# Altium schematic sheet Load8.SchDoc
size A4; SheetNumber: 11; SheetTotal: 15
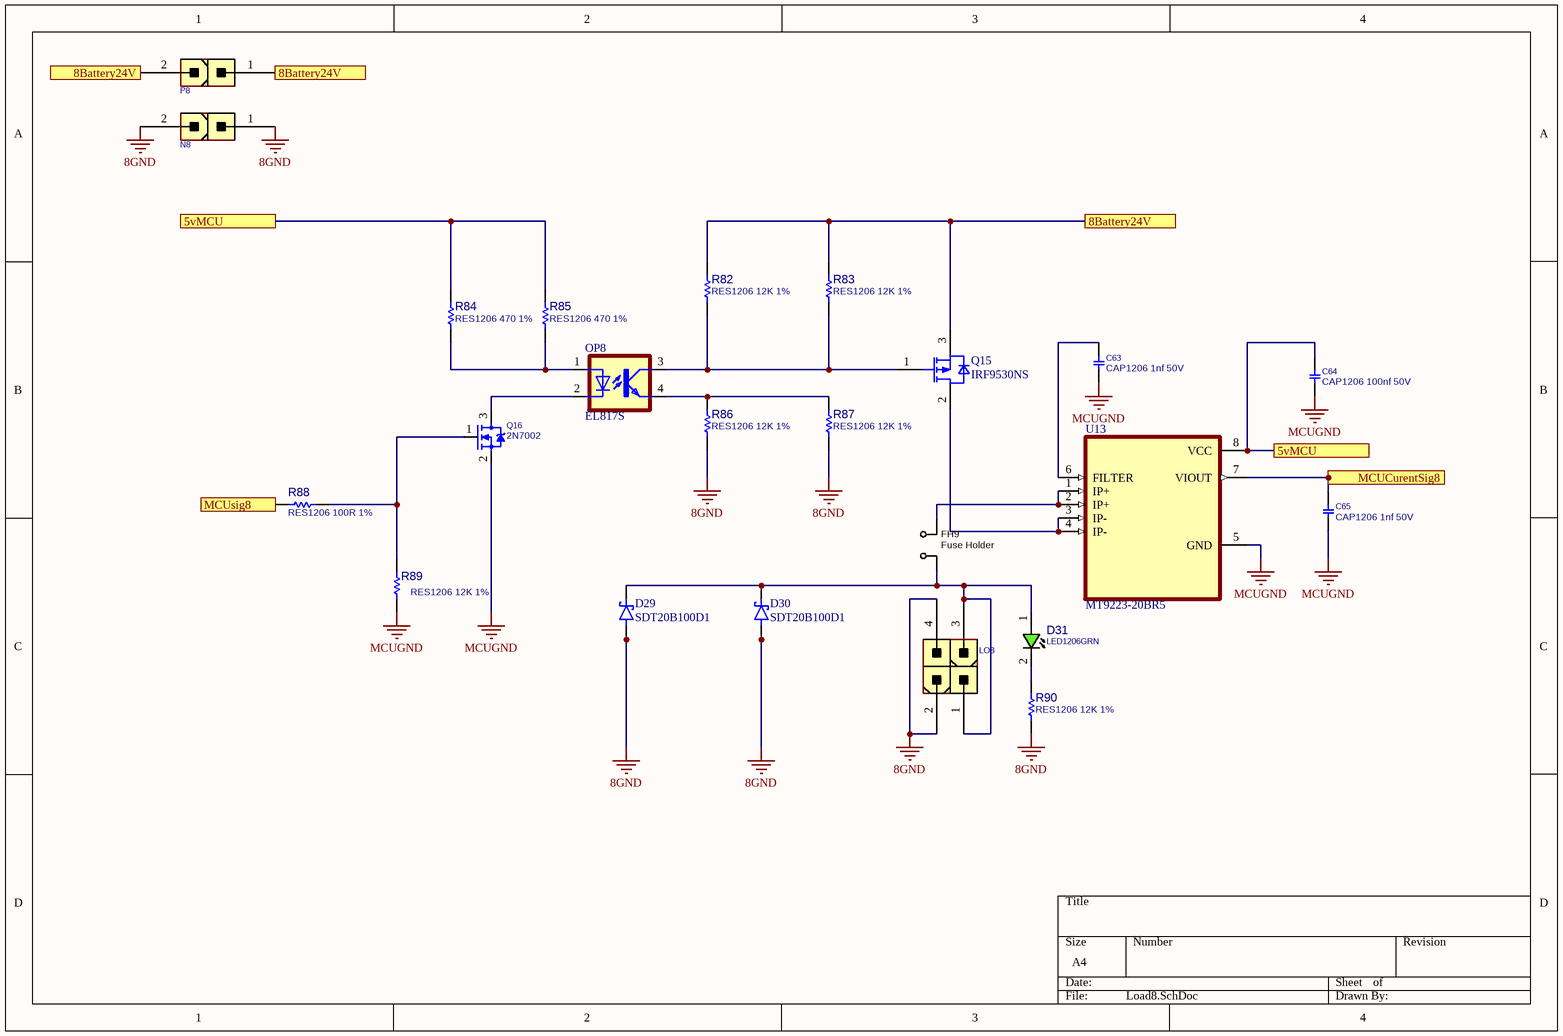
[diagram p0: Load8.SchDoc]

## Parts
C63  CAP1206 1nf 50V  [C1206]
C64  CAP1206 100nf 50V  [C1206]
C65  CAP1206 1nf 50V  [C1206]
D29  SDT20B100D1  [DPAK229P990X238-3N]
D30  SDT20B100D1  [DPAK229P990X238-3N]
D31  LED1206GRN  [LED1206GRN]
FH9  Fuse Holder  [FH_24101812]
LO8  CONN_ATXPWR_4  [ATXPWR_4]  (value not drawn)
N8  CONN_ATXPWR_2  [ATXPWR_2]  (value not drawn)
OP8  EL817S  [SOIC254P1030X460-4N]
P8  CONN_ATXPWR_2  [ATXPWR_2]  (value not drawn)
Q15  IRF9530NS  [TO254P1528X508-4_3N-V1]
Q16  2N7002  [SOT23_3]
R82  RES1206 12K 1%  [R1206]
R83  RES1206 12K 1%  [R1206]
R84  RES1206 470 1%  [R1206]
R85  RES1206 470 1%  [R1206]
R86  RES1206 12K 1%  [R1206]
R87  RES1206 12K 1%  [R1206]
R88  RES1206 100R 1%  [R1206]
R89  RES1206 12K 1%  [R1206]
R90  RES1206 12K 1%  [R1206]
U13  MT9223-20BR5  [SOIC127P600X175-8N]

## Ports
5vMCU, 8Battery24V, MCUCurentSig8, MCUsig8

## Nets
8GND: D29.1(A) D29.3(A__1) D30.1(A) D30.3(A__1) LO8.2 LO8.4 N8.1 N8.2 R86.2 R87.2 R90.2
MCUGND: C63.2 C64.2 C65.2 Q16.2(SOURCE) R89.2 U13.5(GND)
5vMCU: C64.1 R84.2 R85.2 U13.8(VCC) ; port 5vMCU
8Battery24V: P8.1 P8.2 Q15.3(SOURCE) R82.1 R83.1 ; port 8Battery24V
MCUCurentSig8: C65.1 U13.7(VIOUT) ; port MCUCurentSig8
MCUsig8: R88.1 ; port MCUsig8
NetC63_1: C63.1 U13.6(FILTER)
NetD29_4: D29.4(K) D30.4(K) D31.1(ANODE) FH9.1 LO8.1 LO8.3
NetD31_2: D31.2(CATHODE) R90.1
NetFH9_2: FH9.2 U13.1(IP+) U13.2(IP+)
NetOP8_1: OP8.1(A) R84.1 R85.1
NetOP8_2: OP8.2(C) Q16.3(DRAIN)
NetOP8_3: OP8.3(COL) Q15.1(GATE) R82.2 R83.2
NetOP8_4: OP8.4(EMIT) R86.1 R87.1
NetQ15_2: Q15.2(DRAIN) U13.3(IP-) U13.4(IP-)
NetQ16_1: Q16.1(GATE) R88.2 R89.1

## Library data of the parts
C63-C65 = CAP_SMD_MLCC_1206: CAP, MLCC; PARAM: -, -%; MANF_P#: MANF_PART#; PARAM2: -V; PRICE: 100= 1$; MANF: -; ASSEMBLY: ASSEMBLY
D29 D30 = MBRD835L: Diode Schottky 35 V 8A Surface Mount DPAK; MF: ON Semiconductor; SnapEDA_Link: https://www.snapeda.com/parts/MBRD835L/Onsemi/view-part/?ref=snap; Package: TO-252-3 MICROSS/On Semiconductor; Value: *; MP: MBRD835L; Check_prices: https://www.snapeda.com/parts/MBRD835L/Onsemi/view-part/?ref=eda
D31 = LED_SMD_1206_GRN: LED, SMD, 1206, GREEN; PARAM: 20mA; DESC: DESCRIPTION; PARAM2: 2.2V; MANF: -; ASSEMBLY: ASSEMBLY; PRICE: 36t@Javan; MANF_P#: -; VALUE: LED1206GRN; MountType: SMT; PartType: LED
FH9 = FUSE_SMD_HOLDER_24101812: Fuse SMD2410 Holder; PARAM: max. 10A; MANF: Littelfuse; MANF_P#: 01550900M; PARAM2: 125v; PRICE: 0.2$; PACKAGE: SMD,5.0x9.7mm; VALUE: Fuse Holder
LO8 = CONN_ATXPWR_4: CONN, ATX POWER, 4 P; MANF: TE, Molex; MANF_P#: 4-1775099-0, 39281043; VALUE: CONN_ATXPWR_4; MountType: THD; PACKAGE: ATXPWR-4pin; Part Type: Conn.
N8 P8 = CONN_ATXPWR_2: CONN, ATX POWER, 2 P; MANF: Molex; MANF_P#: 39281023; VALUE: CONN_ATXPWR_2; MountType: THD; PACKAGE: ATXPWR-2pin; Part Type: Conn.
OP8 = EL817S: Optoisolator Transistor Output 5000Vrms 1 Channel 4-SMD; MF: Everlight Electronics; SnapEDA_Link: https://www.snapeda.com/parts/EL817S/Everlight+Electronics+Co+Ltd/view-part/?ref=snap; Package: SMD-4 Everlight Electronics Co Ltd; Value: *; MP: EL817S; Check_prices: https://www.snapeda.com/parts/EL817S/Everlight+Electronics+Co+Ltd/view-part/?ref=eda
Q15 = IRF9530NS: OptiMOS - P2 Power-Transistor, P-channel-Enhancement mode, VDS -30V; Manufacturer: Infineon Technologies; Manufacturer Order NumberManufacturer Order Number: IRF9530NS; PackageReference: PG-TO263-3-901
Q16 = MOSN_2N7002_SOT23: MOSFET, N-CH, 60V, 0.3A; MANF: NXP; ASSEMBLY: ASSEMBLY; MANF_P#: 2N7002; PARAM2: 60v; PARAM: 0.3A; PRICE: 0.3t@Javan; VALUE: 2N7002
R82-R90 = RES_SMD_1206: RESISTOR, SMD; PARAM: 1%, 0.25W; DESC: DESCRIPTION; DIST#: MOUSER; MANF_P#: -; MANF: -; ASSEMBLY: ASSEMBLY; PRICE: -; PARAM2: -
U13 = ACS712ELCTR-05B-T: MF: {'manufacturer': u'Allegro MicroSystems'}; Package: None; Price: None; Value: *; MP: ACS712ELCTR-05B-T; Availability: Unavailable